# Altium schematic sheet VREF.SchDoc
size A; SheetNumber: 3; SheetTotal: 7
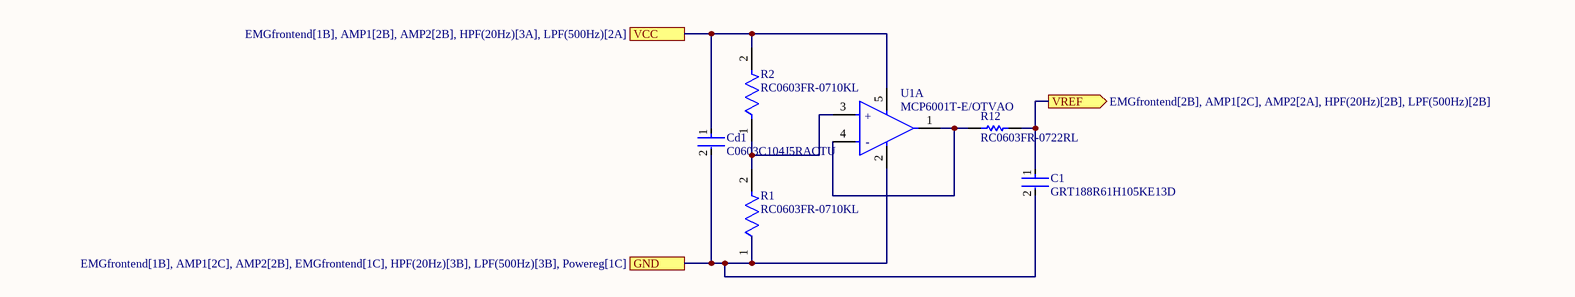
[diagram p0: VREF.SchDoc]

## Parts
C1  GRT188R61H105KE13D  [FP-GRT188-0_1-e0_2_0_5-IPC_B]
Cd1  C0603C104J5RACTU  [FP-C0603C-CF-MFG]
R1  RC0603FR-0710KL  [FP-RC0603-0_55-IPC_C]
R2  RC0603FR-0710KL  [FP-RC0603-0_55-IPC_C]
R12  RC0603FR-0722RL  [RESC1608X55X25NL10T15]
U1A  MCP6001T-E/OTVAO  [FP-C04-091-OT-MFG]

## Ports
GND (see EMGfrontend[1B], AMP1[2C], AMP2[2B], EMGfrontend[1C], HPF(20Hz)[3B], LPF(500Hz)[3B], Powereg[1C]), VCC (see EMGfrontend[1B], AMP1[2B], AMP2[2B], HPF(20Hz)[3A], LPF(500Hz)[2A]), VREF (out, see EMGfrontend[2B], AMP1[2C], AMP2[2A], HPF(20Hz)[2B], LPF(500Hz)[2B])

## Nets
GND: C1.2 Cd1.2 R1.1 U1A.2(VSS) ; port GND
VCC: Cd1.1 R2.2 U1A.5(VDD) ; port VCC
VREF: C1.1 R12.2 ; port VREF
NetR1_2: R1.2 R2.1 U1A.3(VIN+)
NetR12_1: R12.1 U1A.1(VOUT) U1A.4(VIN-)

## Notes on the sheet
- (in symbol CMP-06302-000184-2) +; -

## Library data of the parts
C1 = CMP-06035-031856-1: Multi-Layer Ceramic Capacitor 1uF 50V X5R ±10% 0603 Paper T/R; Voltage Rating (DC): 50V; Voltage Rating: 50V; Min Operating Temperature: -55°C; Case Code (Metric): 1608; Thickness: 0.035inch; Width: 0.031inch; Capacitance: 1uF; Tolerance: 10%; Max Operating Temperature: 85°C; Dielectric: X5R; Case Code (Imperial): 0603; Case/Package: 0603; Length: 0.063inch; Packaging: Tape and Reel; Mount: Surface Mount; Ratings: AEC-Q200
Cd1 = CMP-2006-03056-2: CAP CER 0.1UF 50V 5% X7R 0603; Manufacturer: KEMET; Automotive Grade: Grade 1; Tolerance: 0.05; Capacitance: 0.10 μF; Value: 0.10 μF; Temperature Coefficient: 30ppm/°C; ComponentLink2Description: Datasheet; Voltage Rating: 50 V; Digikey Description: CAP CER 0.1UF 50V 5% X7R 0603; Manufacturer Part Number: C0603C104J5RACTU; Temperature Range High: +125°C; Device Class L2: Capacitors; Octopart: https://octopart.com/c0603c104j5ractu-kemet-10440638; RoHS: TRUE; Mouser Description: Multilayer Ceramic Capacitors MLCC - SMD/SMT 50volts 0.1uF X7R 5%; Temperature Range Low: -55°C; Automotive: Yes; Lead Free: Yes; ComponentLink2URL: https://api.kemet.com/component-edge/download/datasheet/C0603C100J5GACAUTO.pdf; Material: Ceramic; Device Class L3: Ceramic Capacitors; Package: C0603C-CF; Category: Cap; Temperature: -55°C to +125°C; Height: 0.87mm; Temperature Characteristic: X7R; Device Class L1: Passive Components
R1 R2 = CMP-2100-03664-2: RES 10K OHM 1% 1/10W 0603; Voltage Rating: 75V; Voltage Rating (DC): 50V; Resistance: 10kR; Power Rating: 100mW; Temperature Coefficient: 100ppm/°C; Depth: 0.8mm; Termination: SMD/SMT; Resistor Type: Thick Film; Series: RC; Construction: Rectangular; Features: Moisture Resistant; Packaging: Tape and Reel; Min Operating Temperature: -55°C; Number of Terminations: 2; Lead Pitch: 0.3mm; RoHS Compliant: Yes; Case/Package: 0603; Resistance Tolerance: 1%; Military Standard: Not; Weight: 7.1E-05oz; Number of Pins: 2; Tolerance: 1%; Length: 1.6mm; Case Code (Imperial): 0603; Lead Free: Lead Free; Width: 0.8mm; Max Power Dissipation: 100mW; Height: 0.45mm; Max Operating Temperature: 155°C; Case Code (Metric): 1608; Size Code: 0603
R12 = CMP-1659-00033-1: Chip Resistor, 22 Ohm, +/- 1%, 0.1 W, -55 to 155 degC, 0603 (1608 Metric), RoHS, Tape and Reel; Max Ouput Current: 8 A; Case\Package: SIP; Max Input Voltage: 1.4 V; ComponentLink2URL: http://www.yageo.com/documents/recent/PYu-RC_Group_51_RoHS_L_04.pdf; RoHSCompliant: true; Max Operating Temperature: 100 degC; PackageDescription: 2-Pin Surface Mount Device, Body 1.6 x 0.8 mm; ComponentLink1Description: Manufacturer URL; ComponentLink1URL: http://www.yageo.com/; Length: 18.5 mm; REACH SVHC: Unknown; Pins: 4; DatasheetVersion: Rev. 4, 02/2016; PackageReference: 0603; Output Current: 8 A; Min Operating Temperature: -25 degC; Height: 19.6 mm; Mount: Through Hole; Radiation Hardening: No; ComponentLink2Description: Datasheet; Package Quantity: 200; Packaging: Rail/Tube
U1A = CMP-06302-000184-2: None; NexarPartId: 52876797; Min Supply Voltage: 1.8V; Output Current per Channel: 23mA; Max Junction Temperature (Tj): 150°C; Input Bias Current: 1.1nA; Max Supply Voltage: 6V; Input Offset Voltage (Vos): 4.5mV; Voltage Gain: 112dB; Nominal Supply Current: 100µA; Number of Channels: 1; RoHS: Non-Compliant; Height: 1.45mm; Max Operating Temperature: 125°C; Ambient Temperature Range High: 125°C; Case/Package: SOT-23-5; Min Operating Temperature: -40°C; Lifecycle Status: Production